# Altium schematic sheet FK.SchDoc: ИЛ1428ТО1/1
size 410 x 297 mm; ApprovedBy: Стерхов В.Д.; CheckedBy: Стерхов В.Д.; Author: Сергеев Д.А.; CompanyName: ГК "СНАБЖЕНИЕ"; DrawnBy: Сергеев Д.А.; Engineer: Сергеев Д.А.; Organization: ГК "СНАБЖЕНИЕ"; DocumentNumber: ИЛ1428ТО1/1; Revision: 1; SheetNumber: 2; SheetTotal: 5
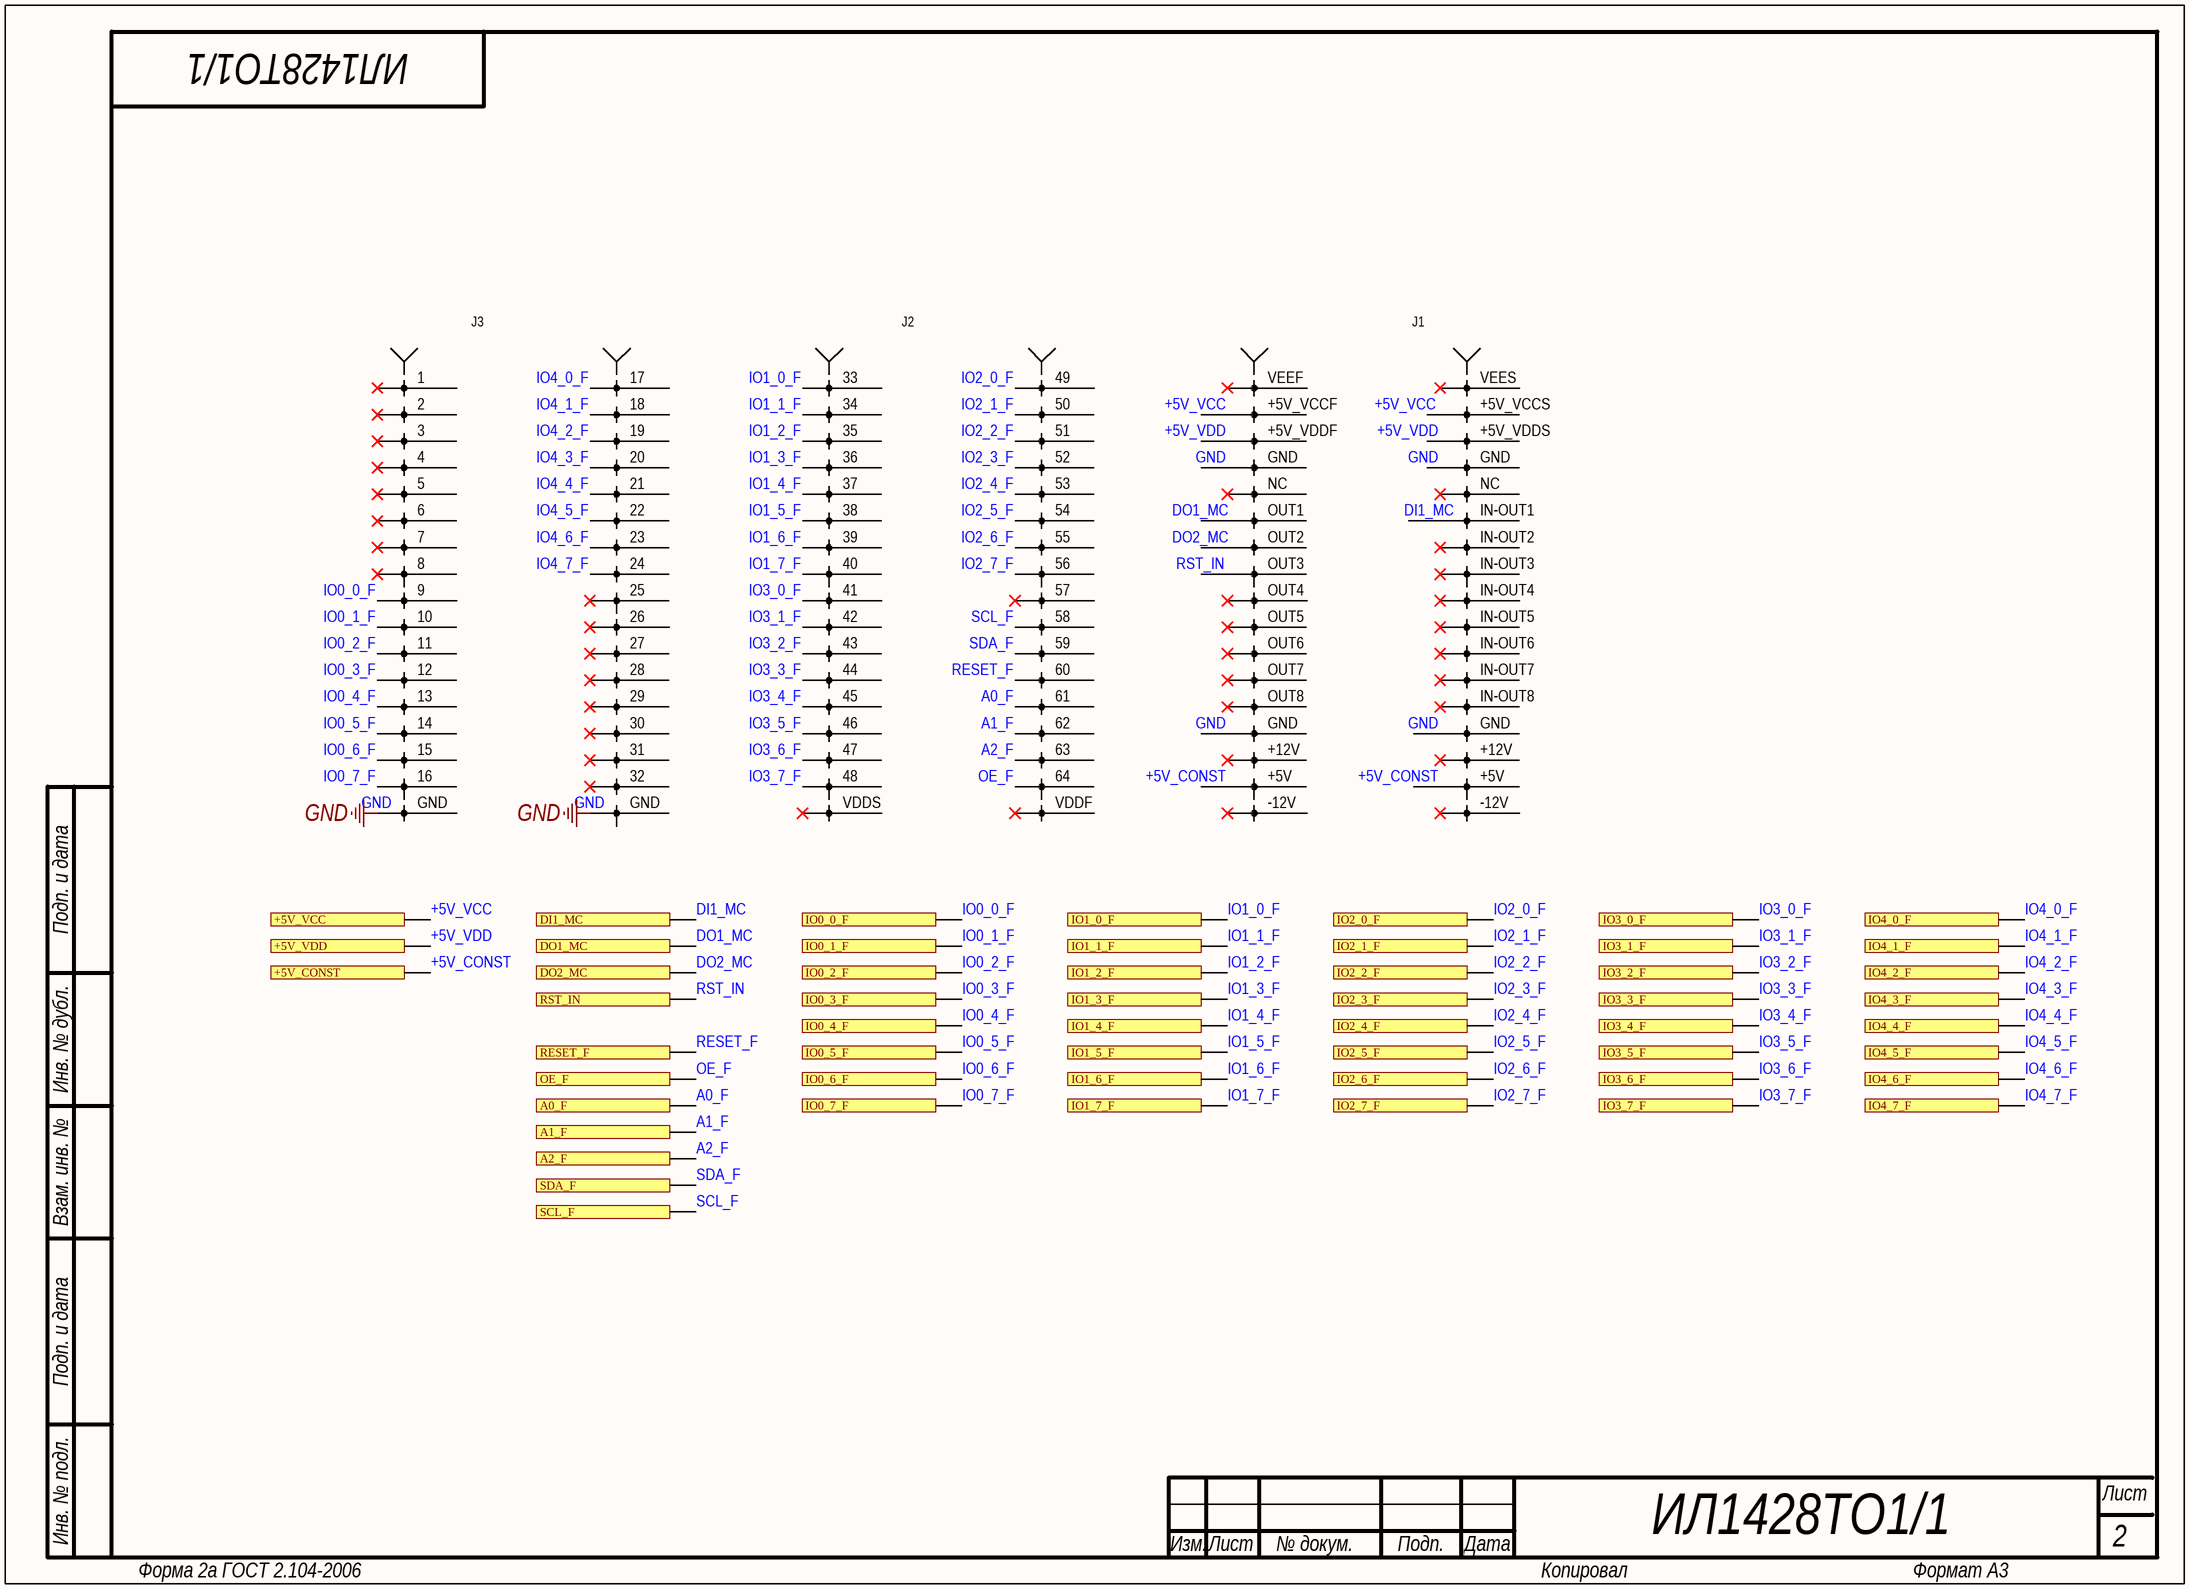
[diagram p0: FK.SchDoc]

## Parts
X1  FORMULA  [FORMULA]  (value not drawn)

## Ports
+5V_CONST, +5V_VCC, +5V_VDD, A0_F, A1_F, A2_F, DI1_MC, DO1_MC, DO2_MC, IO0_0_F, IO0_1_F, IO0_2_F, IO0_3_F, IO0_4_F, IO0_5_F, IO0_6_F, IO0_7_F, IO1_0_F, IO1_1_F, IO1_2_F, IO1_3_F, IO1_4_F, IO1_5_F, IO1_6_F, IO1_7_F, IO2_0_F, IO2_1_F, IO2_2_F, IO2_3_F, IO2_4_F, IO2_5_F, IO2_6_F, IO2_7_F, IO3_0_F, IO3_1_F, IO3_2_F, IO3_3_F, IO3_4_F, IO3_5_F, IO3_6_F, IO3_7_F, IO4_0_F, IO4_1_F, IO4_2_F, IO4_3_F, IO4_4_F, IO4_5_F, IO4_6_F, IO4_7_F, OE_F, RESET_F, RST_IN, SCL_F, SDA_F

## Nets
GND: X1.GND
+5V_CONST: X1.+5V ; port +5V_CONST
+5V_VCC: X1.+5V_VCCF(VCCF) X1.+5V_VCCS(VCCS) ; port +5V_VCC
+5V_VDD: X1.+5V_VDDF(VDDF) X1.+5V_VDDS(VDDS) ; port +5V_VDD
A0_F: X1.61 ; port A0_F
A1_F: X1.62 ; port A1_F
A2_F: X1.63 ; port A2_F
DI1_MC: X1.IN-OUT1 ; port DI1_MC
DO1_MC: X1.OUT1 ; port DO1_MC
DO2_MC: X1.OUT2 ; port DO2_MC
IO0_0_F: X1.9 ; port IO0_0_F
IO0_1_F: X1.10 ; port IO0_1_F
IO0_2_F: X1.11 ; port IO0_2_F
IO0_3_F: X1.12 ; port IO0_3_F
IO0_4_F: X1.13 ; port IO0_4_F
IO0_5_F: X1.14 ; port IO0_5_F
IO0_6_F: X1.15 ; port IO0_6_F
IO0_7_F: X1.16 ; port IO0_7_F
IO1_0_F: X1.33 ; port IO1_0_F
IO1_1_F: X1.34 ; port IO1_1_F
IO1_2_F: X1.35 ; port IO1_2_F
IO1_3_F: X1.36 ; port IO1_3_F
IO1_4_F: X1.37 ; port IO1_4_F
IO1_5_F: X1.38 ; port IO1_5_F
IO1_6_F: X1.39 ; port IO1_6_F
IO1_7_F: X1.40 ; port IO1_7_F
IO2_0_F: X1.49 ; port IO2_0_F
IO2_1_F: X1.50 ; port IO2_1_F
IO2_2_F: X1.51 ; port IO2_2_F
IO2_3_F: X1.52 ; port IO2_3_F
IO2_4_F: X1.53 ; port IO2_4_F
IO2_5_F: X1.54 ; port IO2_5_F
IO2_6_F: X1.55 ; port IO2_6_F
IO2_7_F: X1.56 ; port IO2_7_F
IO3_0_F: X1.41 ; port IO3_0_F
IO3_1_F: X1.42 ; port IO3_1_F
IO3_2_F: X1.43 ; port IO3_2_F
IO3_3_F: X1.44 ; port IO3_3_F
IO3_4_F: X1.45 ; port IO3_4_F
IO3_5_F: X1.46 ; port IO3_5_F
IO3_6_F: X1.47 ; port IO3_6_F
IO3_7_F: X1.48 ; port IO3_7_F
IO4_0_F: X1.17 ; port IO4_0_F
IO4_1_F: X1.18 ; port IO4_1_F
IO4_2_F: X1.19 ; port IO4_2_F
IO4_3_F: X1.20 ; port IO4_3_F
IO4_4_F: X1.21 ; port IO4_4_F
IO4_5_F: X1.22 ; port IO4_5_F
IO4_6_F: X1.23 ; port IO4_6_F
IO4_7_F: X1.24 ; port IO4_7_F
OE_F: X1.64 ; port OE_F
RESET_F: X1.60 ; port RESET_F
RST_IN: X1.OUT3 ; port RST_IN
SCL_F: X1.58 ; port SCL_F
SDA_F: X1.59 ; port SDA_F

Not connected (* = marked no-connect by the designer): X1 1* 2* 3* 4* 5* 6* 7* 8* 25* 26* 27* 28* 29* 30* 31* 32* 57* +12V* -12V* IN-OUT2* IN-OUT3* IN-OUT4* IN-OUT5* IN-OUT6* IN-OUT7* IN-OUT8* NC* OUT4* OUT5* OUT6* OUT7* OUT8* VDDF* VDDS* VEEF* VEES*

## Notes on the sheet
- Подп. и дата
- Инв. № дубл.
- Взам. инв. №
- Инв. № подл.
- Изм.
- Лист
- № докум.
- Подп.
- Дата
- Форма 2а ГОСТ 2.104-2006
- Копировал
- Формат А3
- (in symbol FORMULA) J3; J2; J1